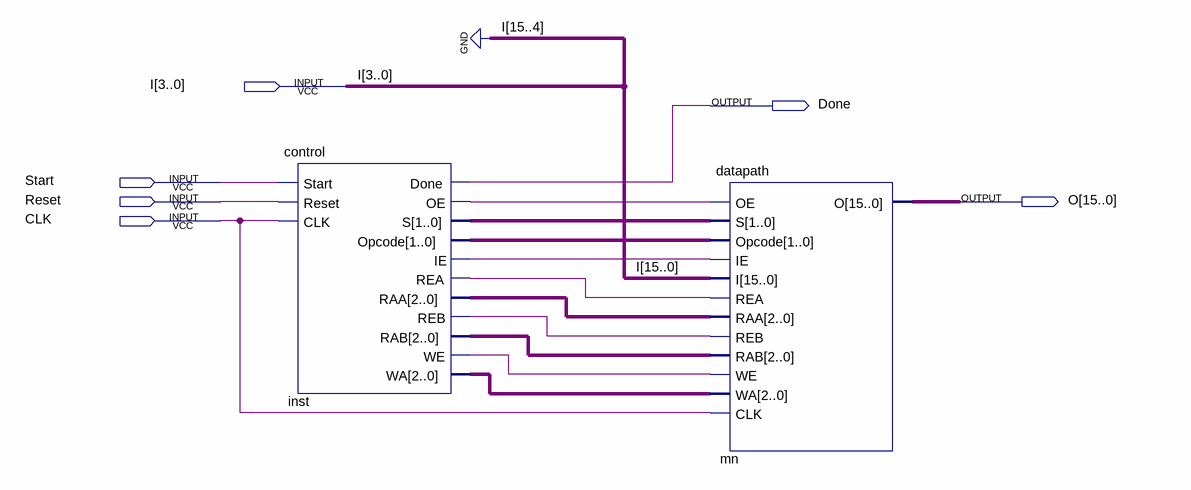
[diagram p0: schematic sheet]
// Quartus schematic processor.bdf as structural Verilog: 2 symbols, 6 pins
module processor (
  input  [3:0] I,
  input  Start,
  input  Reset,
  input  CLK,
  output Done,
  output [15:0] O
);

  wire inst_ie, inst_oe, inst_rea, inst_reb, inst_we;
  wire [1:0] inst_opcode, inst_s;
  wire [2:0] inst_raa, inst_rab, inst_wa;

  control inst (
    .Start(Start), .Reset(Reset), .CLK(CLK), .Done(Done), .OE(inst_oe), .S(inst_s), .Opcode(inst_opcode),
    .IE(inst_ie), .REA(inst_rea), .RAA(inst_raa), .REB(inst_reb), .RAB(inst_rab), .WE(inst_we), .WA(inst_wa));
  datapath mn (
    .OE(inst_oe), .S(inst_s), .Opcode(inst_opcode), .IE(inst_ie), .I({{12{1'b0}}, I}), .REA(inst_rea),
    .RAA(inst_raa), .REB(inst_reb), .RAB(inst_rab), .WE(inst_we), .WA(inst_wa), .CLK(CLK), .O(O));
endmodule
